# Altium project Fob_Transmitter.PrjPcb (part 3 of 3)
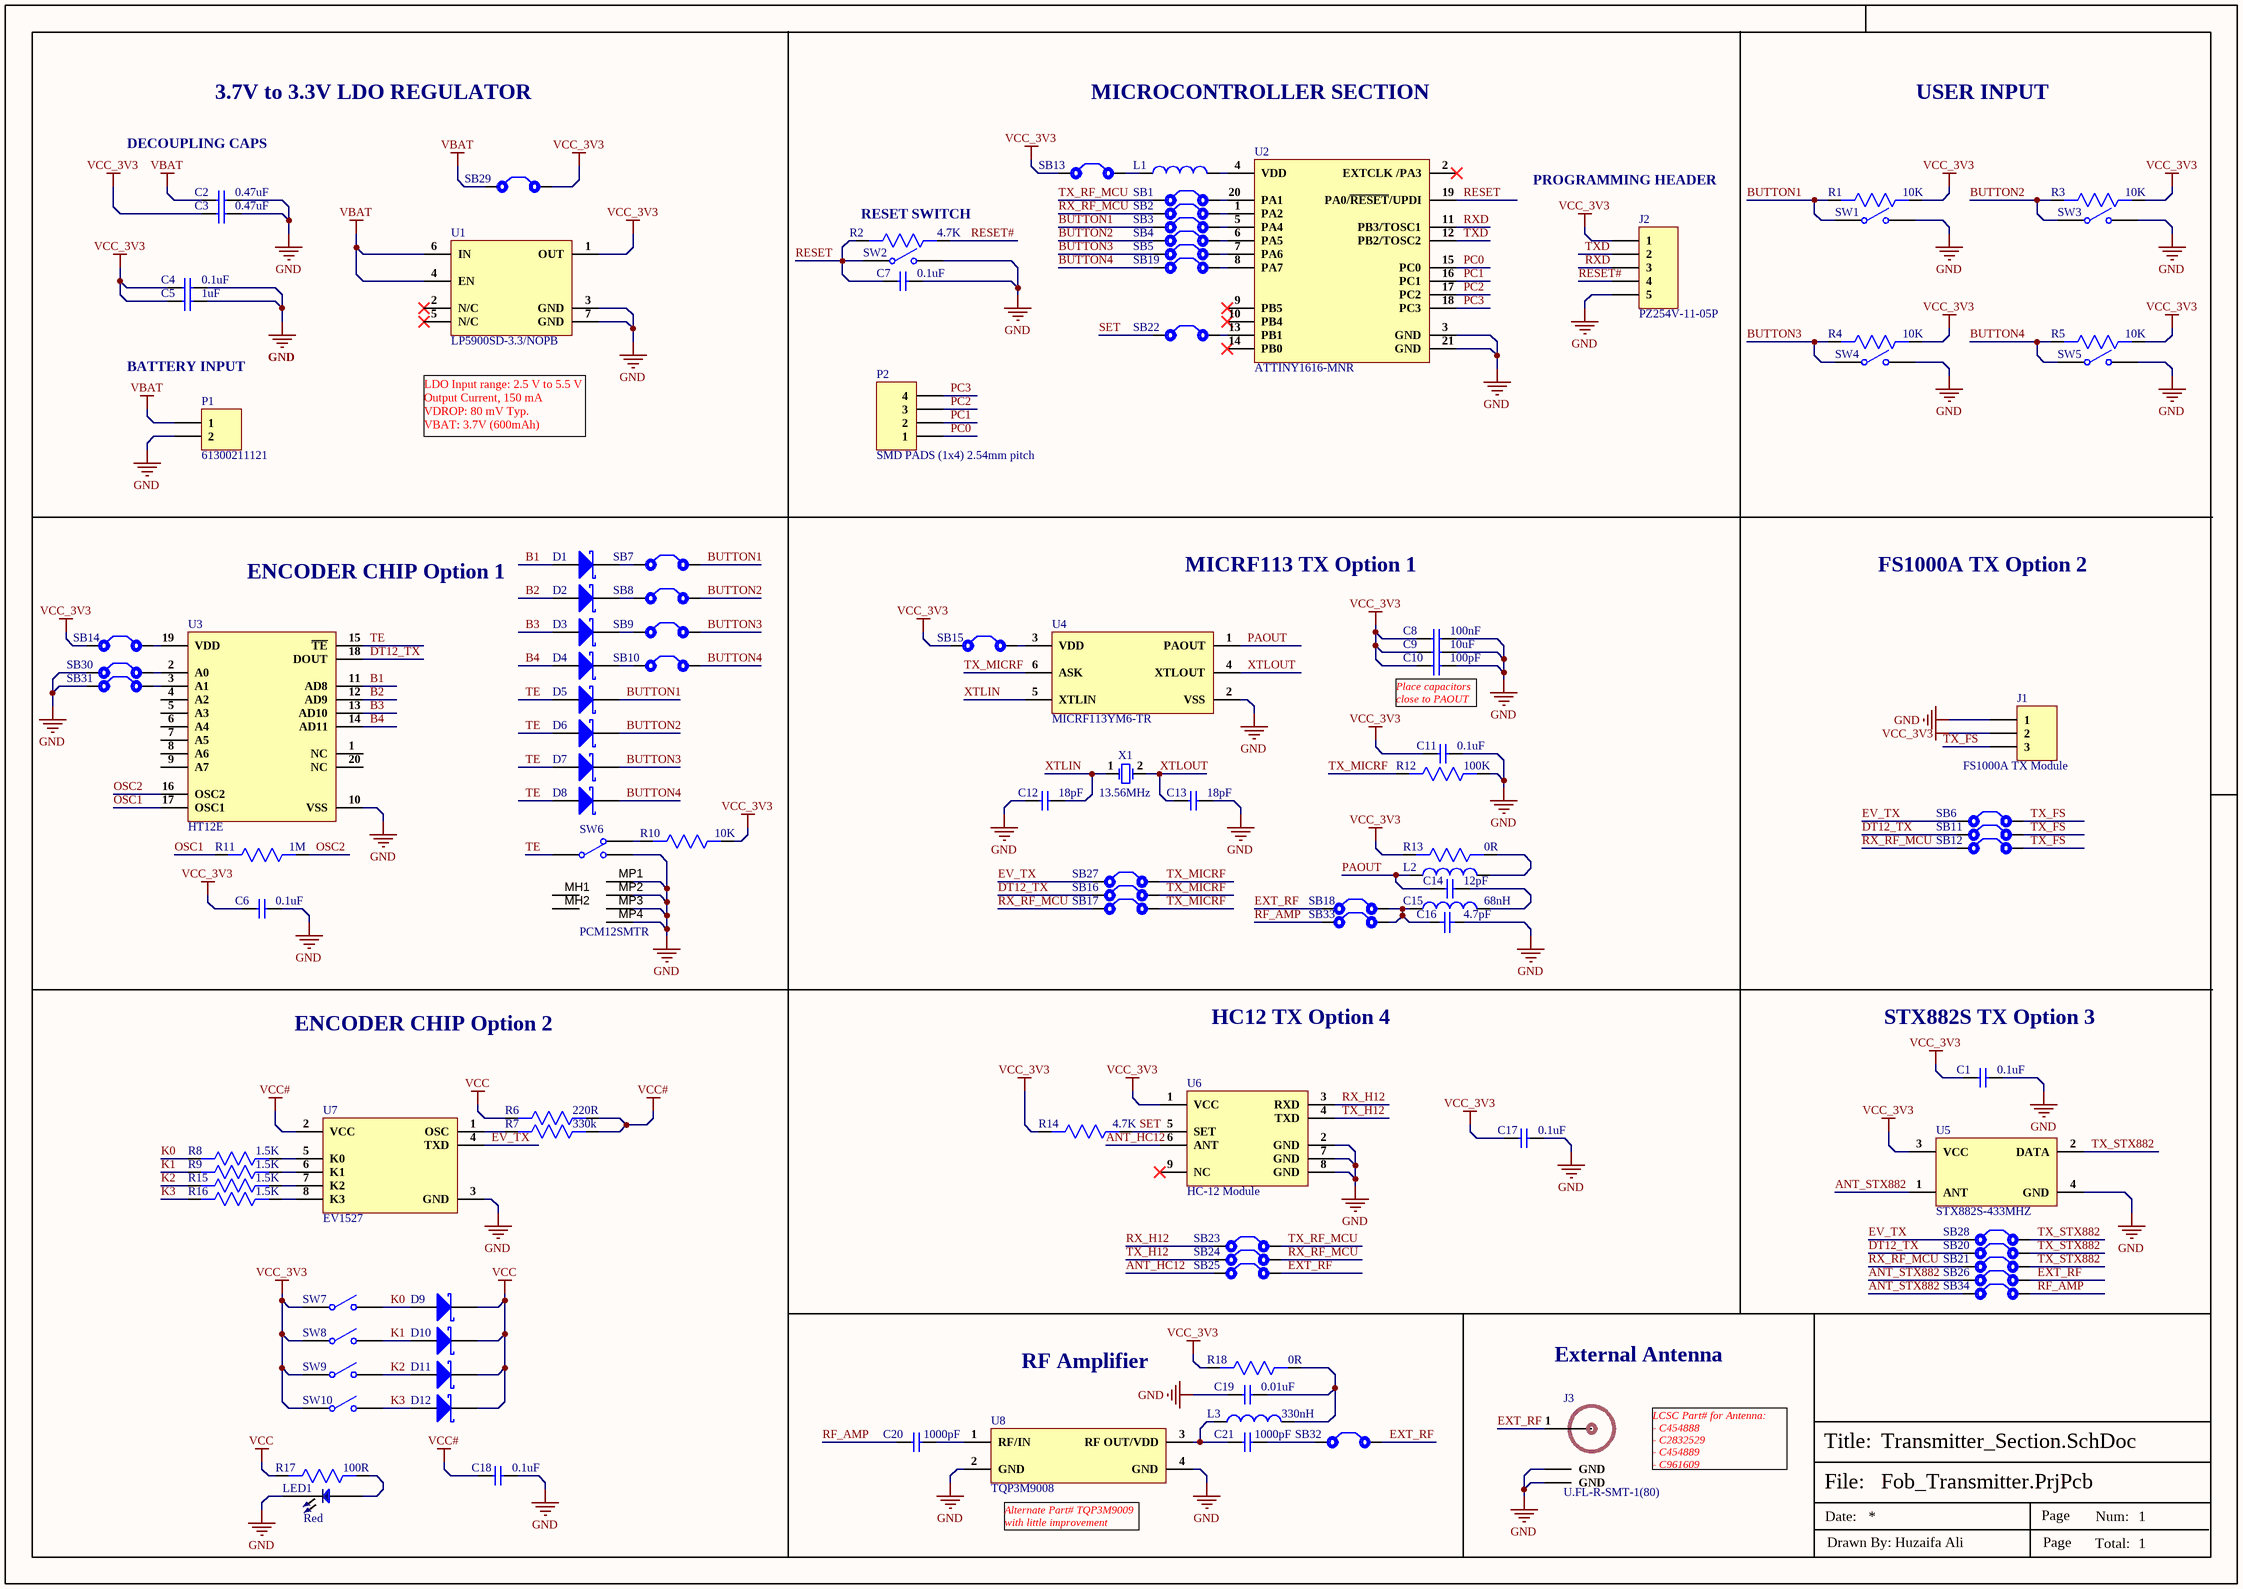
[diagram p2: Transmitter_Section.SchDoc]

## Sheet Transmitter_Section.SchDoc (continued)

### Library data of the parts (continued)
U3 = HT12E: Remote Control Encoder, SMD, SOIC20; Manufacturer: Holtek; Manufacturer Part Number: HT12E-20SOP; Min Supply Voltage: 2.4V; Max Supply Voltage: 12V; Nominal Supply Current: 150uA; Supplier 1: RSComponents; RoHS: Yes; Category: Integrated Circuits (ICs); Stock 1: 1; Pricing 1: 38=1.61900, 76=1.41400, 190=1.33600, 380=1.30900, 760=1.28200 (USD); Case/Package: SOP; Number of Pins: 20; Min Operating Temperature: -20°C; Max Operating Temperature: 75°C; Length: 12.8mm; Width: 7.5mm; Height: 2.35mm; REACH SVHC: No SVHC; ComponentLink1URL: https://datasheet.ciiva.com/1167/57851-1167180.pdf?src-supplier=Element14; ComponentLink1Description: https://datasheet.ciiva.com/1167/57851-1167180.pdf?src-supplier=Element14; Supplier Part Number 1: 8850709
U4 = MICRF113YM6-TR: SOT-23-6 RF Transceiver ICs ROHS; Manufacturer: Microchip; Frequency: 450MHz; Data Rate: 10Kbps; Nominal Supply Current: 12.5mA; Max Supply Voltage: 3.6V; Min Supply Voltage: 1.8V; Operating Frequency: 300 MHz to 450 MHz; Output Power (dBm): 10dBm; Supplier 1: Future Electronics; Manufacturer Part Number: MICRF113YM6-TR; RoHS: Yes; Category: Interface ICs; Stock 1: 12000; Pricing 1: 3000=0.90500 (USD); Case/Package: SOT-23-6; Number of Pins: 6; Min Operating Temperature: -40°C; Max Operating Temperature: 85°C; Package Quantity: 3000; Packaging: Tape and Reel; Current - Transmitting: 12.5mA; Series: -; Supply Current: 12.5mA; Radiation Hardening: No; RoHS Compliant: Yes; ComponentLink1URL: https://datasheet.ciiva.com/2802/micrf113-2802309.pdf?src-supplier=Digi-Key; ComponentLink1Description: https://datasheet.ciiva.com/2802/micrf113-2802309.pdf?src-supplier=Digi-Key; ComponentLink2URL: https://datasheet.ciiva.com/26913/getdatasheetpartid-313552-26913166.pdf?src-supplier=Verical; ComponentLink2Description: https://datasheet.ciiva.com/26913/getdatasheetpartid-313552-26913166.pdf?src-supplier=Verical; ComponentLink3URL: https://datasheet.ciiva.com/2802/micrf113-2802310.pdf?src-supplier=Digi-Key; ComponentLink3Description: https://datasheet.ciiva.com/2802/micrf113-2802310.pdf?src-supplier=Digi-Key; ComponentLink4URL: https://datasheet.ciiva.com/2802/micrf113-2802311.pdf?src-supplier=Digi-Key; ComponentLink4Description: https://datasheet.ciiva.com/2802/micrf113-2802311.pdf?src-supplier=Digi-Key; ComponentLink5URL: https://datasheet.ciiva.com/16217/micrf113-16217142.pdf?src-supplier=Future+Electronics; ComponentLink5Description: https://datasheet.ciiva.com/16217/micrf113-16217142.pdf?src-supplier=Future+Electronics; Supplier Part Number 1: 8229866; LCSC Part Number: C481380
U5 = STX882S-433MHZ: RF Modules ROHS; Manufacturer: G-NiceRF; Manufacturer Part Number: STX882S-433MHZ; LCSC Part Number: C5126754; ComponentLink1Description: LCSC; ComponentLink1URL: https://www.lcsc.com/product-detail/RF-Modules_G-NiceRF-STX882S-433MHZ-SRX882-433MHZ-SW433-TH32_C5126754.html
U6 = HC-12 Module: 433Mhz SI4463 HC-12 Wireless Serial Port Module; ComponentLink1Description: Aliexpress; ComponentLink1URL: https://www.aliexpress.com/item/1005002117548373.html?spm=a2g0o.productlist.main.1.451c79c6Vo7dNy&algo_pvid=93082d1e-6c79-45a0-b51e-4c9c862db0c1&algo_exp_id=93082d1e-6c79-45a0-b51e-4c9c862db0c1-0&pdp_ext_f=%7B%22sku_id%22%3A%2212000018797976000%22%7D&pdp_npi=2%40dis%21USD%214.4%213.74%21%21%21%21%21%4021224e9b16655822763592696d06c5%2112000018797976000%21sea&curPageLogUid=P8YFabe8JKJ6; Manufacturer Part Number: HC-12
U7 = EV1527: SOP-8_150mil Interface - Specialized ROHS; Manufacturer: LCX; Manufacturer Part Number: EV1527; LCSC Part Number: C108704; ComponentLink1Description: LCSC; ComponentLink1URL: https://www.lcsc.com/product-detail/Interface-Specialized_LCX-Shenzhen-LCHSTAR-Elec-EV1527_C108704.html
U8 = TQP3M9008: RF Amp Chip Single GP 4GHz 5.25V 4-Pin(3+Tab) SOT-89; Manufacturer: TriQuint; Operating Supply Voltage: 5V; Number of Channels: 1; Min Supply Voltage: 4.75V; Operating Supply Current: 85mA; Test Frequency: 1.9GHz; Gain: 20.6dB; Operating Frequency: 50 MHz to 4 GHz; Supplier 1: Avnet; Manufacturer Part Number: TQP3M9008; RoHS: Yes; Category: Uncategorized; Mount: Surface Mount; Case/Package: SOT-89; Number of Pins: 4; Weight: 0.004603oz; Min Operating Temperature: -40°C; Max Operating Temperature: 85°C; Packaging: Tape and Reel; Package Quantity: 1000; Frequency: 4GHz; Max Supply Voltage: 5.25V; Bandwidth: 1.9GHz; Series: TQP; Radiation Hardening: No; RoHS Compliant: Yes; ComponentLink1URL: https://datasheet.ciiva.com/8154/tqp3m9008-8154011.pdf?src-supplier=Avnet; ComponentLink1Description: https://datasheet.ciiva.com/8154/tqp3m9008-8154011.pdf?src-supplier=Avnet; ComponentLink2URL: https://datasheet.ciiva.com/15129/getdatasheetpartid-698761-15129568.pdf?src-supplier=Verical; ComponentLink2Description: https://datasheet.ciiva.com/15129/getdatasheetpartid-698761-15129568.pdf?src-supplier=Verical; Supplier Part Number 1: TQP3M9008
X1 = 9BC13560182060C3: 13.56MHz 49S Crystals 18pF 60Ω ±20ppm -40℃~+85℃ HC-49S-2P Crystals ROHS; Manufacturer: JGHC; Manufacturer Part Number: 9BC13560182060C3; Package: HC-49S-2P; LCSC Part Number: C2715873; ComponentLink1Description: LCSC; ComponentLink1URL: https://www.lcsc.com/product-detail/Crystals_JGHC-9BC13560182060C3_C2715873.html